# Altium schematic sheet L4-29-10-Ver1.schdoc (part 1 of 2)
size 420 x 297 mm; SheetNumber: 4; SheetTotal: 8
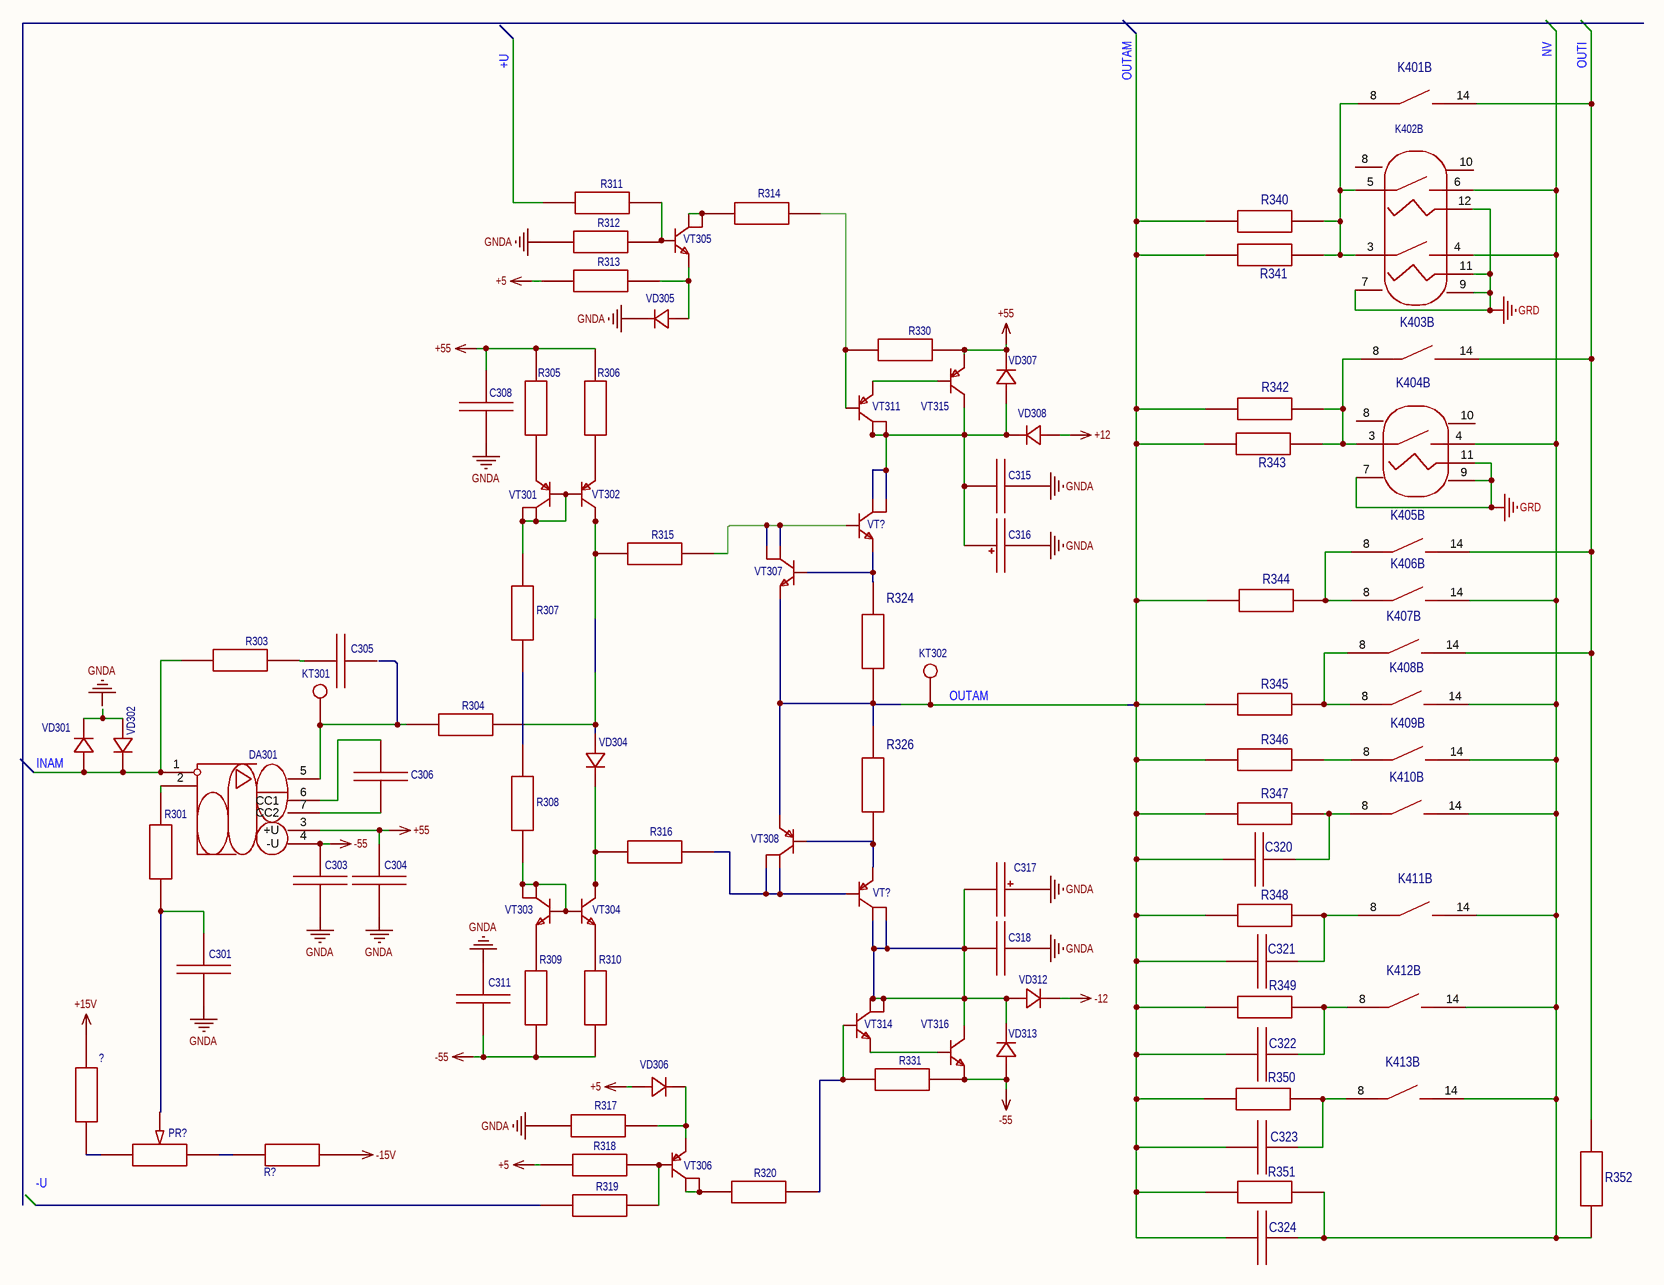
[diagram p0: L4-29-10-Ver1.schdoc]

## Parts
(Parts that share a designator on the sheet are numbered #1, #2 ... from top to bottom, then left to right.)
?  Резистор 10кОм 0,125Вт 1% [0805]  [R0805]  (value not drawn)
C301  Конденсатор SMD 1мкФ 100В X7R 10% [0805]  [C0805]  (value not drawn)
C303  Конденсатор SMD 68нФ 100В X7R 10% [0805]  [C0805]  (value not drawn)
C304  Конденсатор SMD 68нФ 100В X7R 10% [0805]  [C0805]  (value not drawn)
C305  Конденсатор SMD 10пФ 100В X7R 10% [0805]  [C0805]  (value not drawn)
C306  Конденсатор SMD 10пФ 100В X7R 10% [0805]  [C0805]  (value not drawn)
C308  Конденсатор SMD 68нФ 250В X7R 10% [0805]  [C0805]  (value not drawn)
C311  Конденсатор SMD 68нФ 250В X7R 10% [0805]  [C0805]  (value not drawn)
C315  Конденсатор SMD 10пФ 100В X7R 10% [0805]  [C0805]  (value not drawn)
C316  ECAP (К50-35), 220мкФ, 100В, 105°C, 13x25, p:5мм  [CAP-TH_BD13.0-P5.00-D0.6-FD]  (value not drawn)
C317  ECAP (К50-35), 220мкФ, 100В, 105°C, 13x25, p:5мм  [CAP-TH_BD13.0-P5.00-D0.6-FD]  (value not drawn)
C318  Конденсатор SMD 10пФ 100В X7R 10% [0805]  [C0805]  (value not drawn)
C320  Конденсатор К10-17Б М47 33пФ NP0 5% [DIP]  [Конденсатор К10-17Б М47 X.X.xФ  NP0 5% [DIP 5мм]]  (value not drawn)
C321  Конденсатор К10-17Б М47 33пФ NP0 5% [DIP]  [Конденсатор К10-17Б М47 X.X.xФ  NP0 5% [DIP 5мм]]  (value not drawn)
C322  Конденсатор К10-17Б М47 33пФ NP0 5% [DIP]  [Конденсатор К10-17Б М47 X.X.xФ  NP0 5% [DIP 5мм]]  (value not drawn)
C323  Конденсатор К10-17Б М47 33пФ NP0 5% [DIP]  [Конденсатор К10-17Б М47 X.X.xФ  NP0 5% [DIP 5мм]]  (value not drawn)
C324  Конденсатор К10-17Б М47 33пФ NP0 5% [DIP]  [Конденсатор К10-17Б М47 X.X.xФ  NP0 5% [DIP 8мм]]  (value not drawn)
DA301  Операционный усилитель PA340CC [TH]  (value not drawn)
K401  Реле герконовое DIP05-1A72-13L  [PCB]  [RELAY-TH_STANDEXMEDER_DIP05-1A72-13L]  (value not drawn)  (part B of 2)
K402  Реле герконовое УШЯИ.685442.092 (2 реле)  (value not drawn)  (part B of 2)
K403  Реле герконовое DIP05-1A72-13L  [PCB]  [RELAY-TH_STANDEXMEDER_DIP05-1A72-13L]  (value not drawn)  (part B of 2)
K404  Реле герконовое УШЯИ.685442.092 (1 реле)  (value not drawn)  (part B of 2)
K405  Реле герконовое DIP05-1A72-13L  [PCB]  [RELAY-TH_STANDEXMEDER_DIP05-1A72-13L]  (value not drawn)  (part B of 2)
K406  Реле герконовое DIP05-1A72-13L  [PCB]  [RELAY-TH_STANDEXMEDER_DIP05-1A72-13L]  (value not drawn)  (part B of 2)
K407  Реле герконовое DIP05-1A72-13L  [PCB]  [RELAY-TH_STANDEXMEDER_DIP05-1A72-13L]  (value not drawn)  (part B of 2)
K408  Реле герконовое DIP05-1A72-13L  [PCB]  [RELAY-TH_STANDEXMEDER_DIP05-1A72-13L]  (value not drawn)  (part B of 2)
K409  Реле герконовое DIP05-1A72-13L  [PCB]  [RELAY-TH_STANDEXMEDER_DIP05-1A72-13L]  (value not drawn)  (part B of 2)
K410  Реле герконовое DIP05-1A72-13L  [PCB]  [RELAY-TH_STANDEXMEDER_DIP05-1A72-13L]  (value not drawn)  (part B of 2)
K411  Реле герконовое DIP05-1A72-13L  [PCB]  [RELAY-TH_STANDEXMEDER_DIP05-1A72-13L]  (value not drawn)  (part B of 2)
K412  Реле герконовое DIP05-1A72-13L  [PCB]  [RELAY-TH_STANDEXMEDER_DIP05-1A72-13L]  (value not drawn)  (part B of 2)
K413  Реле герконовое DIP05-1A72-13L  [PCB]  [RELAY-TH_STANDEXMEDER_DIP05-1A72-13L]  (value not drawn)  (part B of 2)
KT301  Control point  (value not drawn)
KT302  Control point  (value not drawn)
PR?  Резистор переменный 3329Н 3.3 кОм  [RES-ADJ-TH_3329H]  (value not drawn)
R301  Резистор 4.6кОм 0,125Вт 1% [0805]  [R0805]  (value not drawn)
R303  Резистор 1.8кОм 0,125Вт 1% [0805]  [R0805]  (value not drawn)
R304  Резистор 470Ом 0,125Вт 1% [0805]  [R0805]  (value not drawn)
R305  Резистор 220Ом 0,125Вт 1% [0805]  [R0805]  (value not drawn)
R306  Резистор 220Ом 0,125Вт 1% [0805]  [R0805]  (value not drawn)
R307  Резистор 2.4кОм 0,125Вт 1% [0805]  [R0805]  (value not drawn)
R308  Резистор 2.4кОм 0,125Вт 1% [0805]  [R0805]  (value not drawn)
R309  Резистор 220Ом 0,125Вт 1% [0805]  [R0805]  (value not drawn)
R310  Резистор 220Ом 0,125Вт 1% [0805]  [R0805]  (value not drawn)
R311  Резистор 3кОм 0,125Вт 1% [0805]  [R0805]  (value not drawn)
R312  Резистор 2.4кОм 0,125Вт 1% [0805]  [R0805]  (value not drawn)
R313  Резистор 7.2кОм 0,125Вт 1% [0805]  [R0805]  (value not drawn)
R314  Резистор 18кОм 0,125Вт 1% [0805]  [R0805]  (value not drawn)
R315  Резистор 24Ом 0,125Вт 1% [0805]  [R0805]  (value not drawn)
R316  Резистор 24Ом 0,125Вт 1% [0805]  [R0805]  (value not drawn)
R317  Резистор 7.2кОм 0,125Вт 1% [0805]  [R0805]  (value not drawn)
R318  Резистор 2.4кОм 0,125Вт 1% [0805]  [R0805]  (value not drawn)
R319  Резистор 3кОм 0,125Вт 1% [0805]  [R0805]  (value not drawn)
R320  Резистор 18кОм 0,125Вт 1% [0805]  [R0805]  (value not drawn)
R324  Резистор 220Ом 0,125Вт 1% [0805]  [R0805]  (value not drawn)
R326  Резистор 220Ом 0,125Вт 1% [0805]  [R0805]  (value not drawn)
R330  Резистор 1.5кОм 0,125Вт 1% [0805]  [R0805]  (value not drawn)
R331  Резистор 1.5кОм 0,125Вт 1% [0805]  [R0805]  (value not drawn)
R340  Резистор MP930-0.20-1% [TO-220-2]  [TO-220-2_L10.4-W3.2-P5.08-L]  (value not drawn)
R341  Резистор MP930-0.20-1% [TO-220-2]  [TO-220-2_L10.4-W3.2-P5.08-L]  (value not drawn)
R342  Резистор MP930-2.00-1% [TO-220-2]  [TO-220-2_L10.4-W3.2-P5.08-L]  (value not drawn)
R343  Резистор MP930-2.00-1% [TO-220-2]  [TO-220-2_L10.4-W3.2-P5.08-L]  (value not drawn)
R344  Резистор C2-29B-2 10 Ом ±0,5% [DIP]  (value not drawn)
R345  Резистор C2-29B-1 100 Ом ±0,5% [DIP]  (value not drawn)
R346  Резистор C2-29B-1 1 кОм ±0,5% [DIP]  (value not drawn)
R347  Резистор C2-29B-1 10 кОм ±0,5% [DIP]  (value not drawn)
R348  Резистор C2-29В-0,25 100 кОм ±0,5% [DIP]  (value not drawn)
R349  Резистор C2-29В-0,25 1 МОм ±0,5% [DIP]  (value not drawn)
R350  Резистор RK1/4DCT52R1105F 11 МОм ±1% [DIP]  (value not drawn)
R351  Резистор SM204031006FE 100МОм ±1%[DIP]  [RES-TH_L27.4-W2.5-P22.86-D0.8]  (value not drawn)
R352  Резистор C2-29В-0,25  24кОм ±0,5% [DIP]  (value not drawn)
R?  Резистор 10кОм 0,125Вт 1% [0805]  [R0805]  (value not drawn)
VD301  Диод импульсный 1N4448 [SOD-123]  [SOD-123_L2.7-W1.6-LS3.7-RD-1]  (value not drawn)
VD302  Диод импульсный 1N4448 [SOD-123]  [SOD-123_L2.7-W1.6-LS3.7-RD-1]  (value not drawn)
VD304  Диод импульсный 1N4448 [SOD-123]  [SOD-123_L2.7-W1.6-LS3.7-RD-1]  (value not drawn)
VD305  Диод импульсный 1N4448 [SOD-123]  [SOD-123_L2.7-W1.6-LS3.7-RD-1]  (value not drawn)
VD306  Диод импульсный 1N4448 [SOD-123]  [SOD-123_L2.7-W1.6-LS3.7-RD-1]  (value not drawn)
VD307  Диод RS1M [SMA] (допускается замена на FR307 [DO-201AD])  (value not drawn)
VD308  Диод КД2970А [TO-220AC]  [TO-220AC-2_L10.0-W4.5-P5.08-T]  (value not drawn)
VD312  Диод КД2970А [TO-220AC]  [TO-220AC-2_L10.0-W4.5-P5.08-T]  (value not drawn)
VD313  Диод RS1M [SMA] (допускается замена на FR307 [DO-201AD])  (value not drawn)
VT301  Транзистор FZT758 PNP [SOT223]  [SOT-223-3_L6.5-W3.4-P2.30-LS7.0-BR]  (value not drawn)
VT302  Транзистор FZT758 PNP [SOT223]  [SOT-223_L6.5-W3.5-P2.30-LS7.0-BR]  (value not drawn)
VT303  Транзистор FZT658 NPN [SOT223]  [SOT-223-4_L6.5-W3.5-P2.30-LS7.0-BR]  (value not drawn)
VT304  Транзистор FZT658 NPN [SOT223]  [SOT-223_L6.5-W3.5-P2.30-LS7.0-BR]  (value not drawn)
VT305  Транзистор DZTA42 NPN [SOT223]  [SOT-223-4_L6.5-W3.5-P2.30-LS7.0-BR]  (value not drawn)
VT306  Транзистор DZTA92 PNP [SOT223]  [SOT-223-3_L6.5-W3.4-P2.30-LS7.0-BR]  (value not drawn)
VT307  Транзистор FZT658 NPN [SOT223]  [SOT-223-4_L6.5-W3.5-P2.30-LS7.0-BR]  (value not drawn)
VT308  Транзистор FZT758 PNP [SOT223]  [SOT-223-3_L6.5-W3.4-P2.30-LS7.0-BR]  (value not drawn)
VT311  Транзистор DZTA92 PNP [SOT223]  [SOT-223-3_L6.5-W3.4-P2.30-LS7.0-BR]  (value not drawn)
VT314  Транзистор DZTA42 NPN [SOT223]  [SOT-223-4_L6.5-W3.5-P2.30-LS7.0-BR]  (value not drawn)
VT315  Транзистор MJE5730G PNP [TO-220-3]  [TO-220-3_L10.0-W4.5-P2.54-L]  (value not drawn)
VT316  Транзистор TIP48 NPN [TO-220-3]  [TO-220-3_L10.0-W4.5-P2.54-L]  (value not drawn)
VT?#1  Транзистор DZTA42 NPN [SOT223]  [SOT-223-4_L6.5-W3.5-P2.30-LS7.0-BR]  (value not drawn)
VT?#2  Транзистор DZTA92 PNP [SOT223]  [SOT-223-3_L6.5-W3.4-P2.30-LS7.0-BR]  (value not drawn)

## Nets
+5: R313.1 R318.1 VD306.2(A)
+12: VD308.3(A)
+15V: ?.1
+55: C304.2 C308.1 DA301.3(+U) R305.1 R306.1 R330.2 VD307.1(K) VT315.3(E)
-12: VD312.1(K)
-15V: R?.1
-55: C303.2 C311.2 DA301.4(-U) R309.1 R310.1 R331.2 VD313.2(A) VT316.3(E)
GNDA: C301.1 C303.1 C304.1 C308.2 C311.1 C315.2 C316.2 C317.1 C318.2 R312.1 R317.1 VD305.1(C)
GRD: K402.7 K402.9 K402.11 K402.12 K404.7 K404.9 K404.11
+U: R311.1
INAM: DA301.1(-) R303.2 VD301.2(A) VD302.1(C)
NV: C324.1 K402.4 K402.6 K404.4 K406.14 K408.14 K409.14 K410.14 K411.14 K412.14 K413.14 R351.1 R352.1
OUTAM: C320.2 C321.2 C322.2 C323.2 C324.2 KT302.1 R324.2 R326.1 R340.2 R341.2 R342.2 R343.2 R344.2 R345.2 R346.2 R347.2 R348.2 R349.2 R350.2 R351.2 VT307.3(E) VT308.3(E)
OUTI: K401.14 K403.14 K405.14 K407.14 R352.2
Net?_2: ?.2 PR?.3
NetC301_2: C301.2 R301.1
NetC305_2: C305.2 R303.1
NetC306_1: C306.1 DA301.6(CC1)
NetC306_2: C306.2 DA301.7(CC2)
NetC315_1: C315.1 C316.1 VD307.2(A) VD308.1(K) VT311.2(C) VT311.4(C) VT315.2(C) VT?#1.2(C) VT?#1.4(C)
NetC317_2: C317.2 C318.1 VD312.3(A) VD313.1(K) VT314.2(C) VT314.4(C) VT316.2(C) VT?#2.2(C) VT?#2.4(C)
NetC320_1: C320.1 K410.8 R347.1
NetC321_1: C321.1 K411.8 R348.1
NetC322_1: C322.1 K412.8 R349.1
NetC323_1: C323.1 K413.8 R350.1
NetDA301_2: DA301.2(+) R301.2
NetDA301_5: DA301.5(Out) KT301.1 R304.2
NetK401_8: K401.8 K402.3 K402.5 R340.1 R341.1
NetK403_8: K403.8 K404.3 R342.1 R343.1
NetK405_8: K405.8 K406.8 R344.1
NetK407_8: K407.8 K408.8 R345.1
NetK409_8: K409.8 R346.1
NetPR?_1: PR?.1 R?.2
NetR304_1: R304.1 R315.1 VD304.2(A) VT302.2(C) VT302.4(C)
NetR305_2: R305.2 VT301.3(E)
NetR306_2: R306.2 VT302.3(E)
NetR307_1: R307.1 VT301.1(B) VT301.2(C) VT301.4(C) VT302.1(B)
NetR307_2: R307.2 R308.2
NetR308_1: R308.1 VT303.1(B) VT303.2(C) VT303.4(C) VT304.1(B)
NetR309_2: R309.2 VT303.3(E)
NetR310_2: R310.2 VT304.3(E)
NetR311_2: R311.2 R312.2 VT305.1(B)
NetR313_2: R313.2 VD305.2(A) VT305.3(E)
NetR314_1: R314.1 VT305.2(C) VT305.4(C)
NetR314_2: R314.2 R330.1 VT311.1(B)
NetR315_2: R315.2 VT307.2(C) VT307.4(C) VT?#1.1(B)
NetR316_1: R316.1 VD304.1(C) VT304.2(C) VT304.4(C)
NetR316_2: R316.2 VT308.2(C) VT308.4(C) VT?#2.1(B)
NetR317_2: R317.2 VD306.1(C) VT306.3(E)
NetR318_2: R318.2 R319.2 VT306.1(B)
NetR320_1: R320.1 VT306.2(C) VT306.4(C)
NetR320_2: R320.2 R331.1 VT314.1(B)
NetR324_1: R324.1 VT307.1(B) VT?#1.3(E)
NetR326_2: R326.2 VT308.1(B) VT?#2.3(E)
NetVD301_1: VD301.1(C) VD302.2(A)
NetVT311_3: VT311.3(E) VT315.1(B)
NetVT314_3: VT314.3(E) VT316.1(B)

Not connected (* = marked no-connect by the designer): C305 1; K402 8 10; K404 8 10; PR? 2; R319 1

## Notes on the sheet
- Labels drawn without touching a wire or pin: -U, GNDA
- Подп. и дата
- Инв.№ дубл.
- Взам.инв.№
- Подп.и дата
- Инв.№ подл.
- Изм.
- Лист
- № докум.
- Подп.
- Дата
- Формат  A3